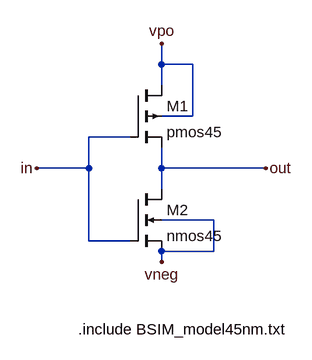
[diagram p0: schematic Inverter.asc]
Inverter.asc, the LTspice schematic file:
Version 4
SHEET 1 880 680
WIRE 224 224 224 192
WIRE 272 224 224 224
WIRE 224 256 224 224
WIRE 272 304 272 224
WIRE 272 304 224 304
WIRE 176 336 112 336
WIRE 112 384 112 336
WIRE 112 384 32 384
WIRE 224 384 224 352
WIRE 384 384 224 384
WIRE 224 416 224 384
WIRE 304 464 224 464
WIRE 112 496 112 384
WIRE 176 496 112 496
WIRE 304 512 304 464
WIRE 304 512 224 512
WIRE 224 528 224 512
FLAG 224 192 vpo
FLAG 224 528 vneg
FLAG 32 384 in
FLAG 384 384 out
SYMBOL pmos4 176 256 R0
SYMATTR InstName M1
SYMATTR Value pmos45
SYMATTR Value2 l=60nm w=400nm
SYMBOL nmos4 176 416 R0
SYMATTR InstName M2
SYMATTR Value nmos45
SYMATTR Value2 l=60nm w=200nm
TEXT 96 632 Left 2 !.include BSIM_model45nm.txt

The netlist it stands for:
* Inverter.asc
M1 vpo in out vpo pmos45 l=60nm w=400nm
M2 out in vneg vneg nmos45 l=60nm w=200nm
.model NMOS NMOS
.model PMOS PMOS
.lib standard.mos
.include BSIM_model45nm.txt
.backanno
.end